# EAGLE design klogger (EAGLE 9.6.2)
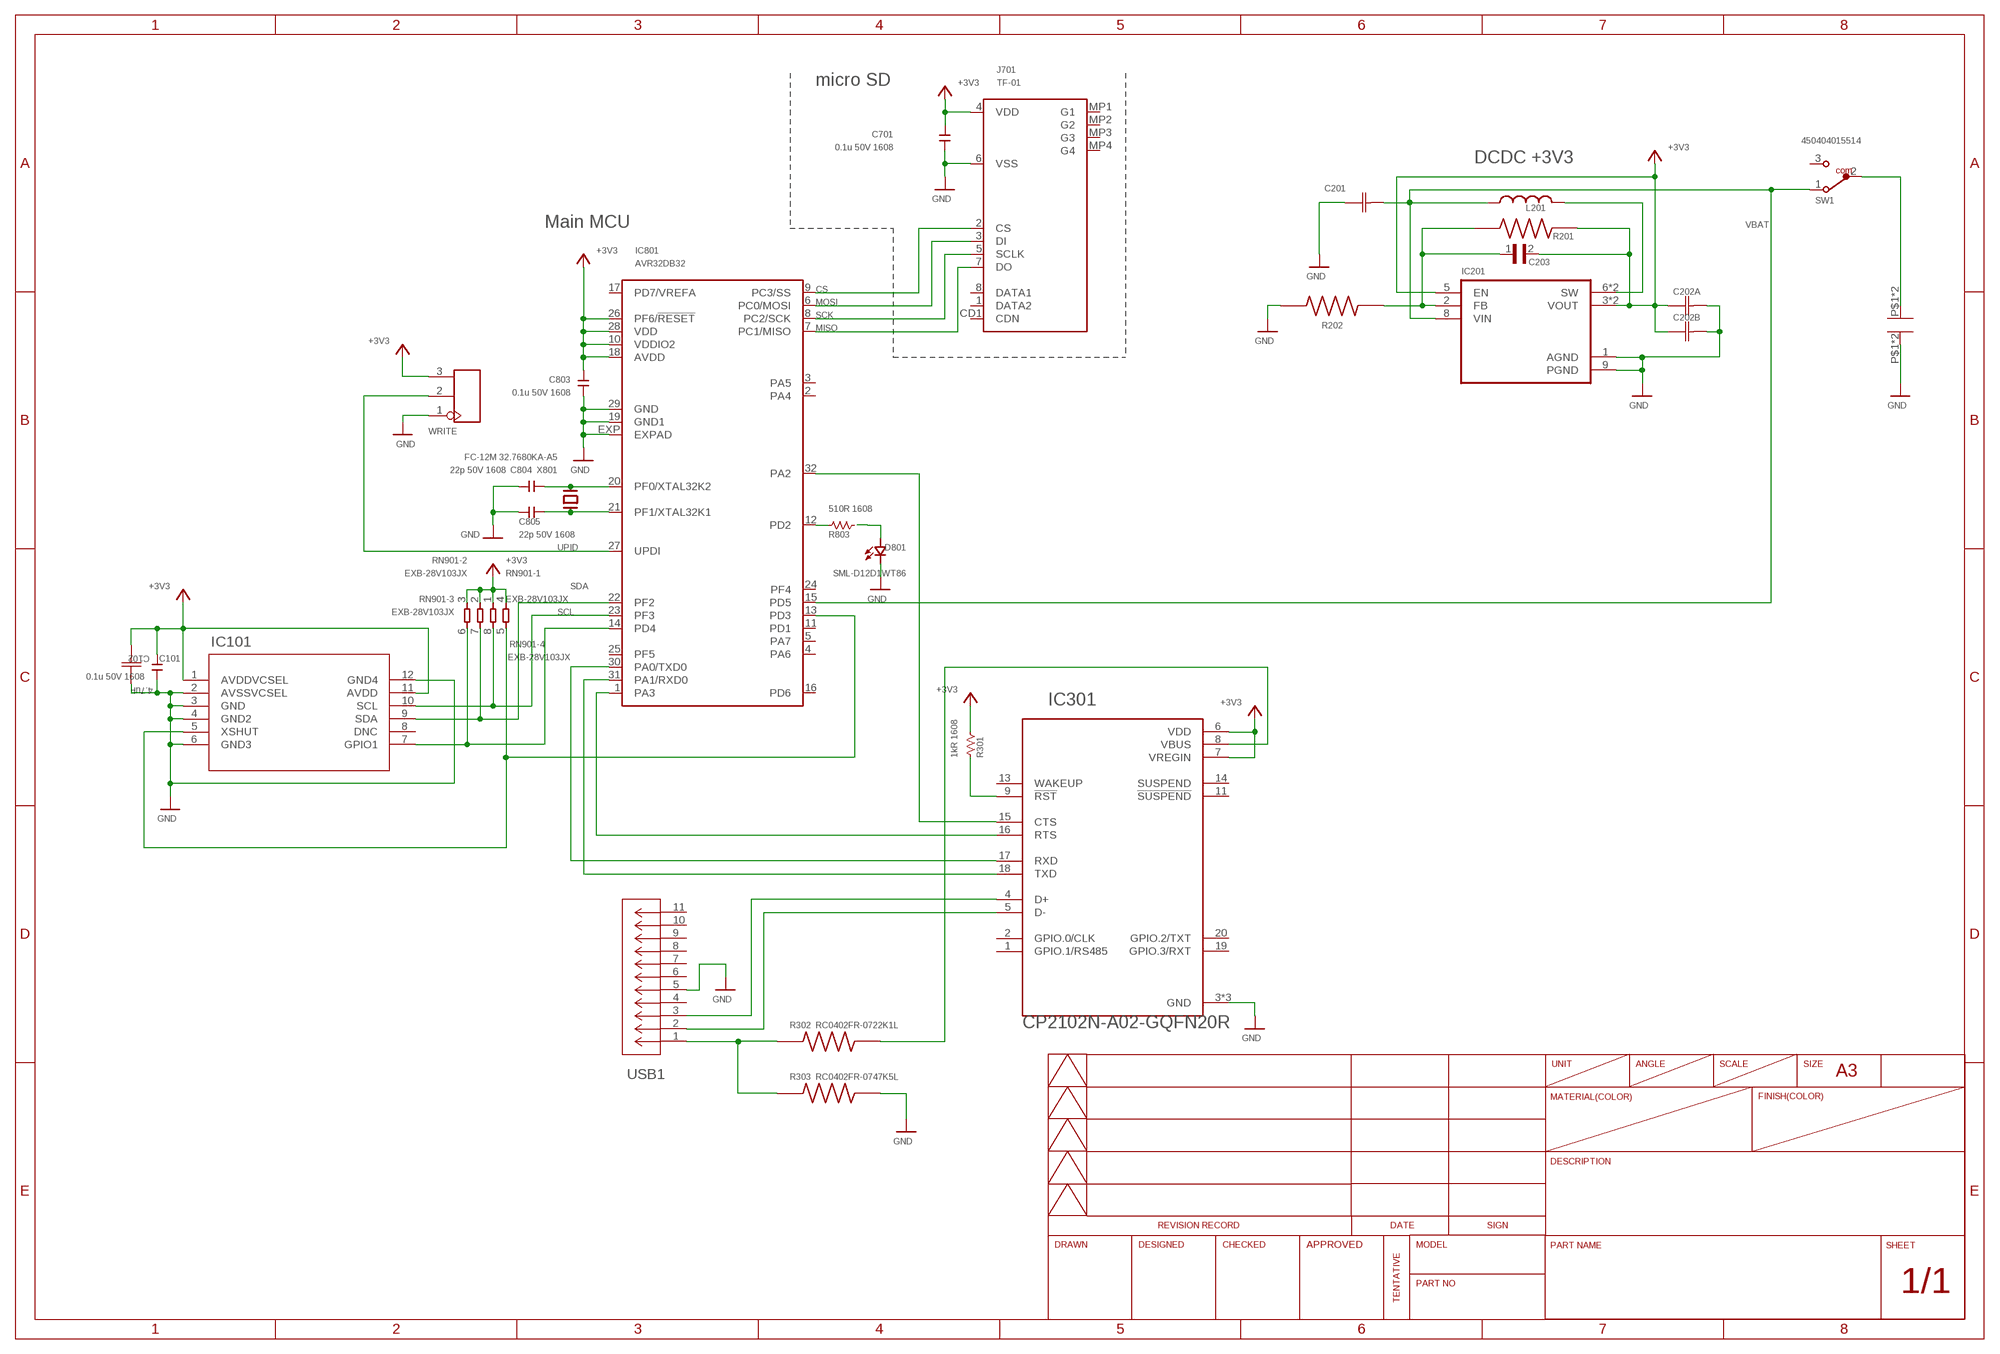
[diagram p0: schematic, sheet 1]

## Parts
BATM  53  [53]
BATP  53  [53]
C101  0.1u 50V 1608  CL10A105KP8NNNC  [C-1608/0603]
C102  4.7uF  GRM21BR61E475KA12L  [CAPC2013X135N]
C201  GRM155R61A106ME11DCAP_GRM155R61A106ME11_MUR  [CAP_GRM155R61A106ME11_MUR]
C202A  GRM188R61A226ME15DCAP_GRM18ME15D_1P6XP8_MUR  [CAP_GRM18ME15D_1P6XP8_MUR]
C202B  GRM188R61A226ME15DCAP_GRM18ME15D_1P6XP8_MUR  [CAP_GRM18ME15D_1P6XP8_MUR]
C203  GJM1555C1H4R7CB01D  [CAPC1005X55N]
C701  0.1u 50V 1608  CL10A105KP8NNNC  [C-1608/0603]
C803  0.1u 50V 1608  CL10A105KP8NNNC  [C-1608/0603]
C804  22p 50V 1608  CL10A105KP8NNNC  [C-1608/0603]
C805  22p 50V 1608  CL10A105KP8NNNC  [C-1608/0603]
D801  SML-D12D1WT86  [SMD-1608]
IC101  VL53L0CXV0DH/1LGA12_STM  [LGA12_STM]
IC201  TPS61021ADSGR  [SON50P200X200X80-9N]
IC301  CP2102N-A02-GQFN20R  [SILABS_CP2102N-A02-GQFN20R]
IC801  AVR32DB32  [HVQFN32]
J701  TF-01  [TF-01A]
L201  DFE252012PD-R47M=P2  [INDC2520X120N]
R201  RC0402FR-071M24L  [RESC1005X40N]
R202  RC0402FR-07390KL  [RESC1005X40N]
R301  1kR 1608  R-1608  [R-1608/0603]
R302  RC0402FR-0722K1L  [RESC1005X40N]
R303  RC0402FR-0747K5L  [RESC1005X40N]
R803  510R 1608  R-1608  [R-1608/0603]
RN901  EXB-28V103JX  [RESCAXS50P200X100X45-8N]
SW1  450404015514  [450404015514]
USB1  1050170001CONN_1050170001_MOL  [CONN_1050170001_MOL]
WRITE  3p-2.54  DIP-BLACK-MALE-HEADER-VERT(3P-2.54)  [H3-2.54]
X801  FC-12M 32.7680KA-A5  SMD-CRYSTAL-32.768KHZ-12.5PF-20PPM-90K(2P-L2.0X1.2MM)  [X2-SMD-L2.0X1.2X0.55MM]

## Nets
+3V3: C101.P$1 C102.2(C2) C202A.1 C202B.1 C203.2 C701.P$1 C803.P$1 IC101.1(AVDDVCSEL) IC101.11(AVDD) IC201.3(VOUT) IC201.4(VOUT) IC201.5(EN) IC301.6(VDD) IC301.7(VREGIN) IC801.10(VDDIO2) IC801.18(AVDD) IC801.26(PF6/!RESET) IC801.28(VDD) J701.4(VDD) R201.2 R301.2 RN901.1 RN901.2 RN901.3 RN901.4 WRITE.3
CS: IC801.9(PC3/SS) J701.2(CS)
FB: C203.1 IC201.2(FB) R201.1 R202.2
GND [PWR]: BATM.P$1 BATM.P$2 C101.P$2 C102.1(C1) C201.1 C202A.2 C202B.2 C701.P$2 C803.P$2 C804.P$2 C805.P$2 D801.2(C) IC101.2(AVSSVCSEL) IC101.3(GND) IC101.4(GND2) IC101.6(GND3) IC101.12(GND4) IC201.1(AGND) IC201.9(PGND) IC301.3(GND) IC301.12(GND) IC301.21(GND) IC801.19(GND1) IC801.29(GND) IC801.EXP(EXPAD) J701.6(VSS) R202.1 R303.2 USB1.5 WRITE.1
GPIO: IC101.7(GPIO1) IC801.14(PD4) RN901.6
LED: IC801.12(PD2) R803.1
MCTS: IC301.16(RTS) IC801.1(PA3)
MISO: IC801.7(PC1/MISO) J701.7(DO)
MOSI: IC801.6(PC0/MOSI) J701.3(DI)
MRTS: IC301.15(CTS) IC801.32(PA2)
MRX: IC301.18(TXD) IC801.31(PA1/RXD0)
MTX: IC301.17(RXD) IC801.30(PA0/TXD0)
N$1: BATP.P$1 BATP.P$2 SW1.2
N$2: R302.1 R303.1 USB1.1
N$3: IC301.9(!RST) R301.1
N$5: IC301.8(VBUS) R302.2
N$39: D801.1(A) R803.2
N$50: C804.P$1 IC801.20(PF0/XTAL32K2) X801.1
N$51: C805.P$1 IC801.21(PF1/XTAL32K1) X801.2
SCK: IC801.8(PC2/SCK) J701.5(SCLK)
SCL: IC101.10(SCL) IC801.23(PF3) RN901.8
SDA: IC101.9(SDA) IC801.22(PF2) RN901.7
SW: IC201.6(SW) IC201.7(SW) L201.2
UPID: IC801.27(UPDI) WRITE.2
USBDM: IC301.5(D-) USB1.2
USBDP: IC301.4(D+) USB1.3
VBAT: C201.2 IC201.8(VIN) IC801.15(PD5) L201.1 SW1.1
XSHUT: IC101.5(XSHUT) IC801.13(PD3) RN901.5
Unconnected: IC101.8(DNC) IC301.1(GPIO.1/RS485) IC301.2(GPIO.0/CLK) IC301.11(!SUSPEND) IC301.13(WAKEUP) IC301.14(SUSPEND) IC301.19(GPIO.3/RXT) IC301.20(GPIO.2/TXT) IC801.2(PA4) IC801.3(PA5) IC801.4(PA6) IC801.5(PA7) IC801.11(PD1) IC801.16(PD6) IC801.17(PD7/VREFA) IC801.24(PF4) IC801.25(PF5) J701.1(DATA2) J701.8(DATA1) J701.CD1(CDN) J701.MP1(G1) J701.MP2(G2) J701.MP3(G3) J701.MP4(G4) SW1.3 USB1.4 USB1.6 USB1.7 USB1.8 USB1.9 USB1.10 USB1.11

## Notes on the sheet
- micro SD
- DCDC +3V3
- Main MCU

## Library data of the parts
BATM BATP = Keystone53:53
C101 C701 C803-C805 = yamaguchi:CL10A105KP8NNNC
C102 = Murata:GRM21BR61E475KA12L: CAPACITOR, 0805; MPN: GRM21BR61E475KA12L; OC_FARNELL: 1735529; OC_NEWARK: 24R6340; SUPPLIER: Murata; TOLERANCE: ±10%; VOLTAGERATING: 25V
C201 = GRM155R61A106ME11D:GRM155R61A106ME11D; COPYRIGHT: Copyright (C) 2025 Ultra Librarian. All rights reserved.; MANUFACTURER_NAME: Murata; MANUFACTURER_PART_NUMBER: GRM155R61A106ME11D; TYPE: Ceramic Capacitors
C202A C202B = GRM188R61A226ME15D:GRM188R61A226ME15D; COPYRIGHT: Copyright (C) 2025 Ultra Librarian. All rights reserved.; MANUFACTURER_NAME: Murata; MANUFACTURER_PART_NUMBER: GRM188R61A226ME15D
C203 = GJM1555C1H4R7CB01D:GJM1555C1H4R7CB01D
D801 = yamaguchi:SML-D12D1WT86
IC101 = VL53L0CX:VL53L0CXV0DH/1; COPYRIGHT: Copyright (C) 2025 Ultra Librarian. All rights reserved.; DATASHEET: https://www.st.com/resource/en/datasheet/vl53l0x.pdf; DESCRIPTION: Time-of-Flight (ToF) ranging sensor; MANUFACTURER_NAME: STMicroelectronics; MANUFACTURER_PART_NUMBER: VL53L0CXV0DH/1
IC201 = TPS61021ADSGR:TPS61021ADSGR
IC301 = CP2102N-A02-GQFN20R:CP2102N-A02-GQFN20R; MANUFACTURER: SILICON LABS; MAXIMUM_PACKAGE_HIEGHT: 0.8mm; PARTREV: 1.3; STANDARD: Manufacturer Recommendations
IC801 = yamaguchi:AVR32DB32
J701 = yamaguchi:TF-01
L201 = DFE252012PD-R47M_P2:DFE252012PD-R47M=P2
R201 = RC0402FR-071M24L:RC0402FR-071M24L
R202 = RC0402FR-07390KL:RC0402FR-07390KL
R301 R803 = yamaguchi:R-1608: R 1608/0603
R302 = RC0402FR-0722K1L:RC0402FR-0722K1L
R303 = RC0402FR-0747K5L:RC0402FR-0747K5L
RN901 = yamaguchi:EXB-28V103JX
SW1 = 450404015514:450404015514
USB1 = 1050170001:1050170001; COPYRIGHT: Copyright (C) 2025 Ultra Librarian. All rights reserved.; DATASHEET: https://www.molex.com/en-us/products/part-detail-pdf/1050170001?display=pdf; DESCRIPTION: Micro-USB B Receptacle, Bottom Mount, Surface Mount, Lead-Free, 0.60mm Tabs, TID; MANUFACTURER_NAME: Molex Connector Corporation; MANUFACTURER_PART_NUMBER: 1050170001
WRITE = OPL_Connector:DIP-BLACK-MALE-HEADER-VERT(3P-2.54): 320020079
X801 = yamaguchi:SMD-CRYSTAL-32.768KHZ-12.5PF-20PPM-90K(2P-L2.0X1.2MM): 306010020 Check availability <https://pricing.snapeda.com/parts/FC-12M/EPSON/view-part?ref=eda>; AVAILABILITY: In Stock; DESCRIPTION: 32.768 kHz ±30ppm Crystal 12.5pF 90 kOhms 2-SMD, No Lead; MF: EPSON; MP: FC-12M; PACKAGE: SMD-2 EPSON; PRICE: None; PURCHASE-URL: https://pricing.snapeda.com/search/part/FC-12M/?ref=eda

## Net classes
0 default: width 0.127 mm
1 GND: width 0.127 mm
2 PWR: width 0.127 mm

## Board
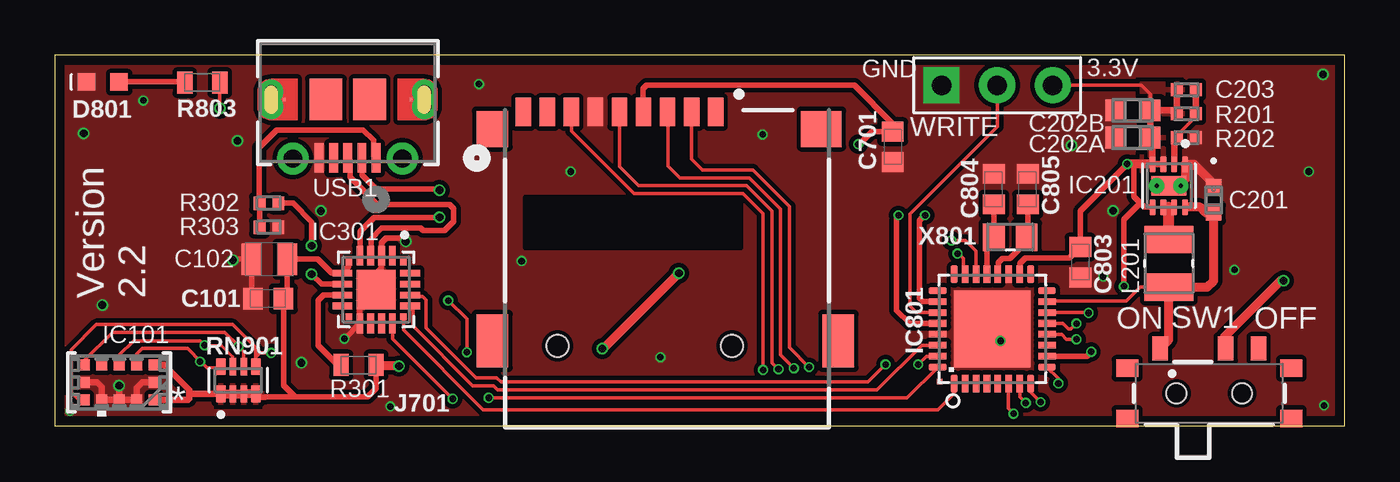
[diagram p1: board, top side]
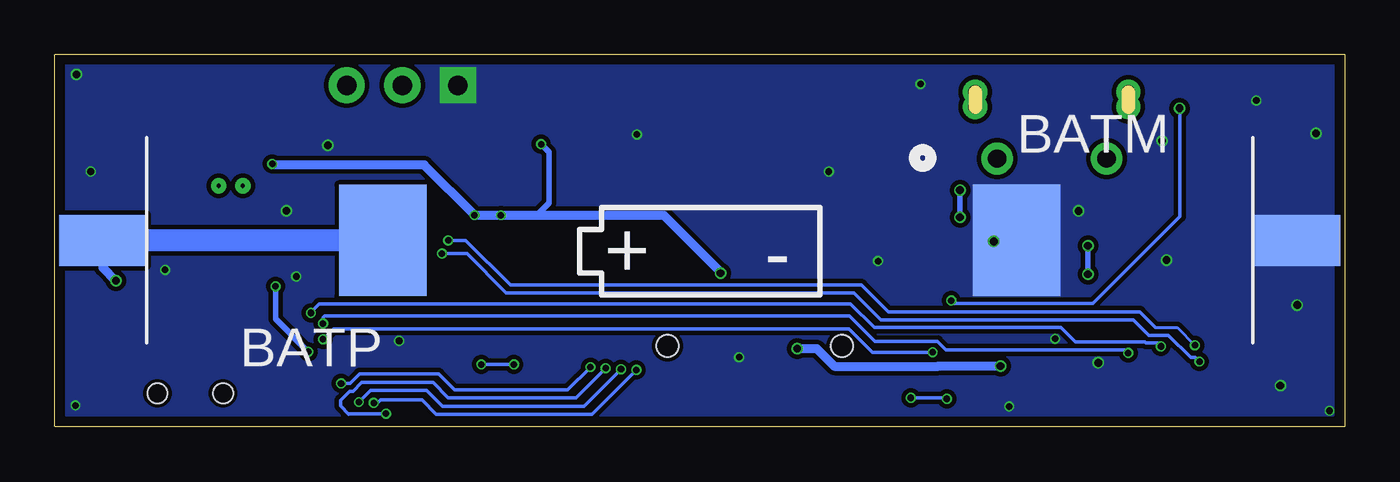
[diagram p2: board, bottom side, seen from below]

Size 59 x 17 mm. Coordinates in mm from the lower left corner, seen from the top.
Outline: 0,17 59,17 59,0 0,0 0,17
Copper layers (1*16): Top 0.035mm / dielectric 1.2mm / Bottom 0.035mm
Design rules "jlcpcb-2layers-custom *": minimum track width 5mil, minimum drill 0.3mm, track to track 0.205mm, track to pad 0.205mm, pad to pad 0.205mm, via to via 0.205mm, smd to smd 5mil, copper to edge 0.2mm, drill to drill 6mil, minimum pad ring 10mil, minimum via ring 3mil, stop-mask expansion 0.002540625mm, vias tented up to drill 0.5mm, thermal gap 10mil

### Footprints (pad centres in the part's own frame; a part is rotated, then mirrored left to right if it is on the bottom)
53 = smd 4 x 5.1: P$1 2,0 | smd 4 x 2.34: P$2 14.8,0
C-1608/0603 = smd 0.9 x 1: P$1 -0.7,0; P$2 0.7,0
CAPC2013X135N = smd 0.914 x 1.448: 1 -0.813,0; 2 0.813,0
CAP_GRM155R61A106ME11_MUR = smd 0.711 x 0.711: 1 -0.597,0; 2 0.597,0
CAP_GRM18ME15D_1P6XP8_MUR = smd 0.906 x 1: 1 -0.803,0; 2 0.803,0
CAPC1005X55N = smd 0.54 x 0.6: 1 -0.432,0; 2 0.432,0
SMD-1608 = smd 0.8 x 0.8: 1 -0.75,0; 2 0.75,0
LGA12_STM = smd 0.5 x 0.5: 1 -1.6,0.8; 2 -0.8,0.8; 3 0,0.8; 4 0.8,0.8; 5 1.6,0.8; 6 1.6,0; 7 1.6,-0.8; 8 0.8,-0.8; 9 0,-0.8; 10 -0.8,-0.8; 11 -1.6,-0.8; 12 -1.6,0
SON50P200X200X80-9N = smd 0.74 x 0.28: 1 -0.985,0.75; 2 -0.985,0.25; 3 -0.985,-0.25; 4 -0.985,-0.75; 5 0.985,-0.75; 6 0.985,-0.25; 7 0.985,0.25; 8 0.985,0.75 | smd 0.9 x 1.6: 9 0,0 | drill 0.2 pad 0.4: 9_1 0,0.55; 9_2 0,-0.55
SILABS_CP2102N-A02-GQFN20R = smd 0.3 x 0.3: 1 -1.25,1.25; 6 -1.25,-1.25; 11 1.25,-1.25; 16 1.25,1.25 | smd 0.9 x 0.3: 2 -1.55,0.75; 3 -1.55,0.25; 4 -1.55,-0.25; 5 -1.55,-0.75; 12 1.55,-0.75; 13 1.55,-0.25; 14 1.55,0.25; 15 1.55,0.75 | smd 0.3 x 0.9: 7 -0.75,-1.55; 8 -0.25,-1.55; 9 0.25,-1.55; 10 0.75,-1.55; 17 0.75,1.55; 18 0.25,1.55; 19 -0.25,1.55; 20 -0.75,1.55 | smd 1.8 x 1.8: 21 0,0
HVQFN32 = smd 0.8 x 0.3: 1 -2.5,1.75; 2 -2.5,1.25; 3 -2.5,0.75; 4 -2.5,0.25; 5 -2.5,-0.25; 6 -2.5,-0.75; 7 -2.5,-1.25; 8 -2.5,-1.75; 17 2.5,-1.75; 18 2.5,-1.25; 19 2.5,-0.75; 20 2.5,-0.25; 21 2.5,0.25; 22 2.5,0.75; 23 2.5,1.25; 24 2.5,1.75 | smd 0.3 x 0.8: 9 -1.75,-2.5; 10 -1.25,-2.5; 11 -0.75,-2.5; 12 -0.25,-2.5; 13 0.25,-2.5; 14 0.75,-2.5; 15 1.25,-2.5; 16 1.75,-2.5; 25 1.75,2.5; 26 1.25,2.5; 27 0.75,2.5; 28 0.25,2.5; 29 -0.25,2.5; 30 -0.75,2.5; 31 -1.25,2.5; 32 -1.75,2.5 | smd 3.5 x 3.5: EXP 0,0 | smd 0.25 x 0.25: M1 -2.415,2.415
TF-01A = smd 0.7 x 1.3: 1 2.23,7.174; 2 1.13,7.174; 3 0.03,7.174; 4 -1.07,7.174; 5 -2.17,7.174; 6 -3.27,7.174; 7 -4.37,7.174; 8 -5.47,7.174; CD1 -6.57,7.174 | smd 1.448 x 1.651: MP1 -7.989,6.4 | smd 1.448 x 2.438: MP2 -7.989,-3.3; MP3 7.836,-3.3 | smd 1.854 x 1.651: MP4 7.061,6.4 | hole 1: -5.004,-3.531; 2.972,-3.531
INDC2520X120N = smd 1.24 x 2.22: 1 -1.09,0; 2 1.09,0
RESC1005X40N = smd 0.54 x 0.6: 1 -0.432,0; 2 0.432,0
R-1608/0603 = smd 0.7 x 1: 1 -0.8,0; 2 0.8,0
RESCAXS50P200X100X45-8N = smd 0.79 x 0.44: 1 -0.62,0.8; 4 -0.62,-0.8; 5 0.62,-0.8; 8 0.62,0.8 | smd 0.79 x 0.34: 2 -0.62,0.25; 3 -0.62,-0.25; 6 0.62,-0.25; 7 0.62,0.25
450404015514 = smd 0.7 x 1.1: 1 2.25,-2.05; 2 -0.75,-2.05; 3 -2.25,-2.05 | smd 1 x 0.8: Z1 -3.75,1.15; Z2 3.75,1.15; Z3 3.75,-1.15; Z4 -3.75,-1.15 | hole 0.9: -1.5,0; 1.5,0
CONN_1050170001_MOL = smd 0.406 x 1.346: 1 -1.3,2.53; 2 -0.65,2.53; 3 0,2.53; 4 0.65,2.53; 5 1.3,2.53 | drill 0.838 pad 1.448: 6 -2.5,2.555; 7 2.5,2.555 | smd 0.127 x 0.127: 8 -2.9,-0.145; 9 2.9,-0.145 | smd 1.499 x 1.905: 10 -1,-0.145; 11 1,-0.145 | drill 0.61 pad 0.61: S_1_H1 -3.5,0.198; S_1_H2 -3.5,-0.488; S_2_H1 3.5,0.198; S_2_H2 3.5,-0.488
H3-2.54 = drill 0.889 pad 1.651 square: 1 0,2.54 | drill 0.889 pad 1.651: 2 0,0; 3 0,-2.54
X2-SMD-L2.0X1.2X0.55MM = smd 1 x 1.25: 1 -0.75,0; 2 0.75,0

### Placement (x,y rotation side)
BATM  17,8.5 0 bottom
BATP  42,8.5 180 bottom
C101  9.76,5.83 180 top
C102  9.81,7.64 0 top
C201  53,10.35 270 top
C202A  49.3,13.2 180 top
C202B  49.3,14.45 180 top
C203  51.75,15.4 180 top
C701  38.32,12.78 270 top
C803  46.9,7.5 270 top
C804  44.5,10.85 90 top
C805  42.95,10.85 90 top
D801  2.2,15.75 180 top
IC101  2.95,2 180 top
IC201  50.95,11 270 top
IC301  14.7,6.25 270 top
IC801  42.88,4.45 90 top
J701  28,7.2 0 top
L201  50.95,7.45 90 top
R201  51.75,14.3 180 top
R202  51.75,13.2 180 top
R301  13.9,2.8 0 top
R302  9.8,10.2 0 top
R303  9.8,9.1 0 top
R803  6.75,15.72 180 top
RN901  8.4,2.1 90 top
SW1  52.8,1.5 180 top
USB1  13.4,14.8 180 top
WRITE  43.1,15.6 90 top
X801  43.7,8.65 180 top

### Tracks (layer width: path | path; a pad name or v marks a point on that pad's centre or on a via)
+3V3  (via drill 0.3, 0.35)
  Top 0.127: 26.9,14.44 J701.4 | 7.47,1.49 RN901.1
  Top 0.152: 9.3,1.38 9.3,1.33 | WRITE.3 49.7,15.6 50.1,15.2 C202B.1
  Top 0.254: 26.9,14.44 26.9,15.44 27.06,15.6 36.57,15.6 38.32,13.85 C701.P$1 37.38,13.48 36.8,12.9 v36.75,12.9 | 9.3,1.33 9.63,1.33 11,1.33 | 11,1.33 14.3,1.33 14.7,1.73 R301.2 | 11,1.33 10.46,1.87 C101.P$1 10.62,5.99 C102.2 12.03,7.64 12.67,7 IC301.7 13.45,7.3 IC301.6 | v49.05,12 46.9,9.85 C803.P$1 46.39,7.69 44.4,7.69 44.15,7.44 44.15,6.97 IC801.18 | IC801.10 47.2,3.2 v47.4,3.4 | IC801.26 39.7,5.7 39.55,5.85 39.55,9.4 v39.8,9.65 | IC801.28 39.1,4.7 38.5,5.3 38.5,9.56 v38.59,9.65 | IC201.5 49.84,10.02 49.65,10.2 | 49.65,10.2 49.35,10.5 49.35,11.98 | 49.65,10.2 48.9,9.45 v48.9,6.4
  Top 0.305: IC101.11 5,2.8 6.15,1.65 6.15,1.5 | 6.15,1.5 6.15,1.25 6.1,1.2 IC101.1 | RN901.1 6.17,1.48 6.15,1.5 | C203.2 R201.2 51.32,14.45 C202B.1 C202A.1 50.2,13.2 IC201.4 IC201.3
  Top 0.406: IC201.4 49.35,11.98 49.06,11.98 v49.05,12 | v28.55,7 25.1,3.55 v25.05,3.55 | v15.75,2.75 14.75,2.75 R301.2 | RN901.1 RN901.2 RN901.3 RN901.4 9.3,1.38
  Bottom 0.254: v36.75,12.9 36.4,12.55 36.4,10.2 36.95,9.65 | v48.9,6.4 48.9,4.9 v47.4,3.4
  Bottom 0.406: v49.05,12 49,11.95 42.1,11.95 v39.8,9.65 v38.59,9.65 36.95,9.65 31.15,9.65 28.55,7.05 v28.55,7 | v25.05,3.55 24.15,3.55 23.35,2.74 18.59,2.74 18.58,2.75 v15.75,2.75
  pour Top: 7.35,1.9 7.35,1.05 9.5,1.05 9.5,1.9
  pour Top: 50.8,11.6 49.65,11.6 49.65,15.75 51.65,15.75 51.65,14 50.8,14
CS  (via drill 0.3)
  Top 0.152: IC801.9 45.9,2.18 v45.9,1.95 | v34.5,2.7 33.6,3.6 33.6,10.04 31.93,11.71 29.64,11.71 29.13,12.22 J701.2
  Bottom 0.152: v45.9,1.95 45.5,1.95 45.05,2.4 41.45,2.4 40.71,1.66 35.54,1.66 v34.5,2.7
FB
  Top 0.15: 51.32,13.3 R202.2 | R201.1 52.18,14.16
  Top 0.152: 52.18,14.16 51.32,13.3
  Top 0.305: IC201.2 51.2,13.08 R202.2 | R201.1 C203.1
GND  (via drill 0.3, 0.35)
  Top 0.254: C101.P$2 9,5.89 C102.1 8.19,7.64 v8.15,7.6 | v16.05,8.45 16.05,8.6 15.15,8.6 14.95,8.4 IC301.3 14.93,7.78 14.93,7.21 14.7,6.98 IC301.21 13.95,5.5 IC301.12 v13.25,4
  Top 0.305: IC101.6 1.95,2 2.15,1.8 IC101.4 IC101.3 | IC101.12 4,2 3.75,1.75 IC101.2 IC101.3 | IC101.3 v2.95,1.85
  Top 0.406: IC801.EXP 43.25,4.08 v43.25,3.9 | IC201.9 51.4,11 51.7,11.3 IC201.1 52.1,11.98 53,11.09 C201.1
  other vias: 2.17,5.54 8.35,13.05 58,16.1 23.6,11.65 1.32,13.39 11.28,2.9 12.18,9.85 32.38,13.35 48.4,9.85 46.5,12.85 47.95,6.85 19.4,15.65 15.35,0.9 27.7,3.15 21.35,7.55 57.35,11.65 58.05,0.95 0.7,0.7 4.05,14.9 53.95,7.15
  pour Top (rank 2, no thermals): 0.5,16.5 58.5,16.5 58.5,0.5 0.5,0.5
  pour Bottom (rank 2, no thermals): 0.5,16.5 58.5,16.5 58.5,0.5 0.5,0.5
GPIO  (via drill 0.3)
  Top 0.152: IC101.7 1.35,3 2.64,4.29 7.78,4.29 8.41,3.66 | 8.41,3.66 8.65,3.43 RN901.6 | 8.41,3.66 v8.41,3.65 | v47.28,5.18 47.26,5.2 IC801.14
  Bottom 0.152: v8.41,3.65 8.56,3.8 9.11,3.8 9.15,3.85 12.33,3.85 12.99,4.51 21.52,4.51 22.6,5.59 46.91,5.59 47.28,5.22 v47.28,5.18
LED  (via drill 0.3, 0.35)
  Top 0.152: R803.1 v7.55,14.55 | v18,5.75 18.85,4.9 v18.85,3.38 | IC801.12 46.05,4.2 46.27,3.98 v46.73,3.98
  Bottom 0.152: v7.55,14.55 7.55,9.6 11.53,5.62 17.87,5.62 v18,5.75 | v46.73,3.98 46.25,4.45 23.65,4.45 22.68,4.45 21.61,3.38 v18.85,3.38
MCTS
  Top 0.152: IC801.1 41.13,1.48 40.4,0.75 19.6,0.75 15.95,4.4 IC301.16
MISO  (via drill 0.3)
  Top 0.127: 23.58,14.28 J701.7
  Top 0.152: IC801.7 44.13,1.34 v44.41,1.06 | v32.4,2.57 32.4,9.73 31.49,10.64 26.49,10.64 23.63,13.5 J701.7
  Bottom 0.152: v44.41,1.06 44.22,1.06 44.09,1.2 42.2,1.2 41.55,0.55 34.42,0.55 v32.4,2.57
MOSI  (via drill 0.3)
  Top 0.127: 28.06,14.28 J701.3
  Top 0.152: IC801.6 43.61,1.93 43.61,0.81 v43.85,0.57 | v33.8,2.65 33.2,3.25 33.2,9.94 31.78,11.36 28.59,11.36 28.06,11.89 28.06,14.28
  Bottom 0.152: v43.85,0.57 43.98,0.57 44,0.56 45.55,0.56 45.55,0.55 45.92,0.93 45.92,1.18 45.51,1.59 45.35,1.59 44.95,1.99 41.69,1.99 41,1.3 35.15,1.3 v33.8,2.65
MRTS  (via drill 0.3)
  Top 0.152: IC801.32 38.98,1.3 20.09,1.3 20.09,1.29 v19.85,1.29 | v18.2,1.25 15.45,4 IC301.15
  Bottom 0.152: v19.85,1.29 18.24,1.29 v18.2,1.25
MRX  (via drill 0.3)
  Top 0.152: IC801.31 39.87,3.2 v39.49,2.82 | v38,2.82 37.2,2.01 20.4,2.01 20.21,2.21 19.27,2.21 16.98,4.5 16.98,5.77 16.82,5.93 16.32,5.93 IC301.18
  Bottom 0.152: v39.49,2.82 v38,2.82
MTX
  Top 0.152: IC801.30 39.65,3.7 37.61,1.66 20.26,1.66 20.06,1.85 19.12,1.85 16.38,4.59 16.38,5.27 16.25,5.4 IC301.17
N$1  (via drill 0.35)
  Top 0.406: SW1.2 53.5,3.6 53.5,4.1 56.05,6.65 v56.2,6.65
  Bottom 0.406: BATP.P$2 56.8,7.25 v56.2,6.65
  Bottom 1.016: BATP.P$1 BATP.P$2
N$2
  Top 0.254: USB1.1 14.59,12.38 14.59,13.08 14.12,13.55 10.15,13.55 9.35,12.75 9.35,10.22 R302.1 R303.1
N$3
  Top 0.254: IC301.9 12.3,6 12.05,5.75 12.05,3.7 12.95,2.8 R301.1
N$5  (via drill 0.35)
  Top 0.254: R302.2 10.9,10.2 11.75,9.35 v11.75,8.25 | v11.75,6.95 12.2,6.5 IC301.8
  Bottom 0.254: v11.75,8.25 v11.75,6.95
N$39
  Top 0.127: 3,15.77 D801.1 | 5.81,15.77 R803.2
  Top 0.254: 5.81,15.77 3,15.77
N$50
  Top 0.254: IC801.20 43.15,6.97 43.15,7.49 43.34,7.68 43.68,7.68 44.45,8.46 X801.1 44.5,8.7 C804.P$1
N$51
  Top 0.254: IC801.21 42.63,8.33 X801.2 C805.P$1
SCK  (via drill 0.3)
  Top 0.127: 25.9,14.28 J701.5
  Top 0.152: IC801.8 44.63,1.56 v45.09,1.1 | v33.1,2.6 32.8,2.9 32.8,9.83 31.64,11 26.7,11 25.83,11.87 J701.5
  Bottom 0.152: v45.09,1.1 44.55,1.64 41.98,1.64 41.26,0.91 34.79,0.91 v33.1,2.6
SCL  (via drill 0.3)
  Top 0.127: RN901.8 7.54,2.66 6.98,2.66
  Top 0.15: IC101.10 3.75,3.3 4,3.55 6.08,3.55 6.68,2.95 6.98,2.66
  Top 0.152: 6.68,2.95 v6.65,2.95 | IC801.23 41.56,7.02 41.56,7.67 41.34,7.89 v41.29,7.89
  Bottom 0.152: v6.65,2.95 6.84,3.15 7.05,3.15 8.06,4.16 8.96,4.16 9.66,4.87 21.22,4.87 22.45,6.1 38.35,6.1 40.14,7.89 v41.29,7.89
SDA  (via drill 0.3)
  Top 0.127: RN901.7 8.15,3.17 7.62,3.7 v6.86,3.7
  Top 0.15: IC101.9 2.95,3.25 3.6,3.9 6.65,3.9 v6.86,3.7
  Top 0.152: IC801.22 42.13,8.02 41.65,8.5 v41,8.5
  Bottom 0.127: 8.67,4.51 7.67,4.51 v6.86,3.7
  Bottom 0.152: v41,8.5 40.2,8.5 38.16,6.46 22.1,6.46 20.86,5.22 9.38,5.22 8.67,4.51
SW
  Top 0.254: IC201.7 51.19,10.02
  Top 0.305: IC201.6 50.95,10.02 51.19,10.02
  Top 0.508: L201.2 50.95,10.02
UPID
  Top 0.152: IC801.27 39.4,5.2 39.1,5.5 39.1,9.7 43.1,13.7 WRITE.2
USBDM  (via drill 0.35)
  Top 0.254: USB1.2 14.05,11.5 14.7,10.85 17.55,10.85 v17.6,10.8 | IC301.5 13.97,7.82 13.97,8.91 14.6,9.54 v17.59,9.54 v17.6,9.55
  Bottom 0.254: v17.6,10.8 v17.6,9.55
USBDP
  Top 0.254: USB1.3 13.52,12.15 13.52,11.39 14.75,10.15 18.05,10.15 18.25,9.95 18.25,9.36 17.84,8.94 16.86,8.94 16.74,9.06 14.96,9.06 14.47,8.57 14.47,7.82 IC301.4
VBAT
  Top 0.152: IC801.15 45.4,5.72 49.02,5.72 49.66,6.36 L201.1
  Top 0.254: IC201.8 51.75,10.02
  Top 0.406: SW1.1 50.95,3.95 L201.1 52.71,6.36 53,6.65 C201.2 52.65,9.75 52.39,10.02 51.75,10.02
XSHUT  (via drill 0.3)
  Top 0.15: IC101.5 1.1,1.2 0.75,1.55 0.75,3.5 1.9,4.65 8.15,4.65 9.1,3.7
  Top 0.152: RN901.5 9.2,3.15 | 9.2,3.15 9.2,3.6 9.1,3.7 | 9.2,3.15 9.4,3.35 v9.89,3.35 v9.9,3.34 | IC801.13 46.1,4.7 46.35,4.45 46.48,4.45 v46.73,4.69
  Bottom 0.152: v9.9,3.34 10.05,3.49 18.25,3.49 18.64,3.88 21.5,3.88 22.65,5.04 46.66,5.04 46.73,4.97 v46.73,4.69

### Text on the board
tPlace: ON | OFF
bPlace: - | +
tNames: GND | 3.3V | Version / 2.2